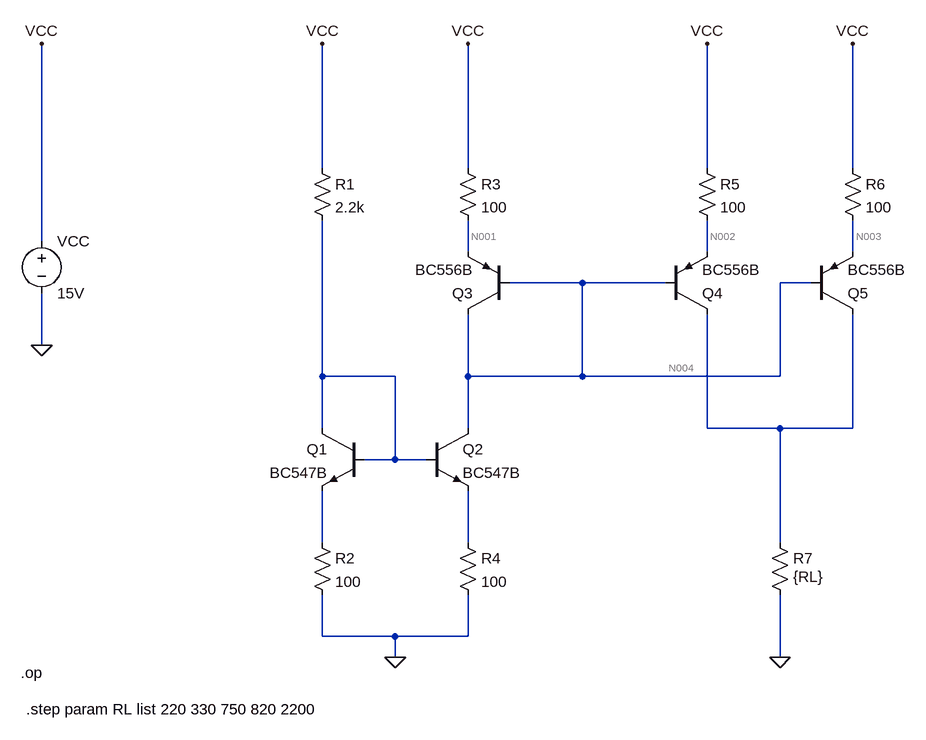
[diagram p0: schematic Draft1.asc]
Draft1.asc, the LTspice schematic file:
Version 4
SHEET 1 1180 896
WIRE -64 48 -64 -144
WIRE 160 48 160 -144
WIRE 528 48 528 -144
WIRE 752 48 752 -144
WIRE -496 160 -496 -144
WIRE 160 176 160 128
WIRE 528 176 528 128
WIRE 752 176 752 128
WIRE 336 224 224 224
WIRE 464 224 336 224
WIRE 688 224 640 224
WIRE -496 320 -496 240
WIRE -64 368 -64 128
WIRE 48 368 -64 368
WIRE 160 368 160 272
WIRE 336 368 336 224
WIRE 336 368 160 368
WIRE 640 368 640 224
WIRE 640 368 336 368
WIRE -64 448 -64 368
WIRE 160 448 160 368
WIRE 528 448 528 272
WIRE 640 448 528 448
WIRE 752 448 752 272
WIRE 752 448 640 448
WIRE 48 496 48 368
WIRE 48 496 0 496
WIRE 96 496 48 496
WIRE -64 624 -64 544
WIRE 160 624 160 544
WIRE 640 624 640 448
WIRE -64 768 -64 704
WIRE 48 768 -64 768
WIRE 160 768 160 704
WIRE 160 768 48 768
WIRE 48 800 48 768
WIRE 640 800 640 704
FLAG 640 800 0
FLAG 48 800 0
FLAG -496 320 0
FLAG -496 -144 VCC
FLAG -64 -144 VCC
FLAG 160 -144 VCC
FLAG 528 -144 VCC
FLAG 752 -144 VCC
SYMBOL res -80 32 R0
SYMATTR InstName R1
SYMATTR Value 2.2k
SYMBOL res -80 608 R0
SYMATTR InstName R2
SYMATTR Value 100
SYMBOL res 144 32 R0
SYMATTR InstName R3
SYMATTR Value 100
SYMBOL res 144 608 R0
SYMATTR InstName R4
SYMATTR Value 100
SYMBOL res 512 32 R0
SYMATTR InstName R5
SYMATTR Value 100
SYMBOL res 736 32 R0
SYMATTR InstName R6
SYMATTR Value 100
SYMBOL res 624 608 R0
WINDOW 3 36 68 Left 2
SYMATTR Value {RL}
SYMATTR InstName R7
SYMBOL npn 0 448 M0
SYMATTR InstName Q1
SYMATTR Value BC547B
SYMBOL npn 96 448 R0
SYMATTR InstName Q2
SYMATTR Value BC547B
SYMBOL pnp 224 272 R180
SYMATTR InstName Q3
SYMATTR Value BC556B
SYMBOL pnp 464 272 M180
SYMATTR InstName Q4
SYMATTR Value BC556B
SYMBOL pnp 688 272 M180
SYMATTR InstName Q5
SYMATTR Value BC556B
SYMBOL voltage -496 144 R0
WINDOW 123 0 0 Left 0
WINDOW 39 0 0 Left 0
SYMATTR InstName VCC
SYMATTR Value 15V
TEXT -528 824 Left 2 !.op
TEXT -520 880 Left 2 !.step param RL list 220 330 750 820 2200

The netlist it stands for:
* Draft1.asc
R1 VCC N005 2.2k
R2 N007 0 100
R3 VCC N001 100
R4 N008 0 100
R5 VCC N002 100
R6 VCC N003 100
R7 N006 0 {RL}
Q1 N005 N005 N007 0 BC547B
Q2 N004 N005 N008 0 BC547B
Q3 N004 N004 N001 0 BC556B
Q4 N006 N004 N002 0 BC556B
Q5 N006 N004 N003 0 BC556B
VCC VCC 0 15V
.model NPN NPN
.model PNP PNP
.lib standard.bjt
.op
.step param RL list 220 330 750 820 2200
.backanno
.end

* Results of the author's LTspice run, read from the files saved beside the schematic
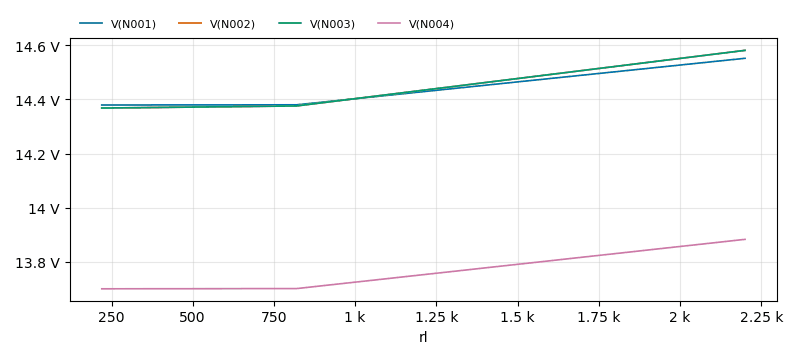
[diagram p1: Operating Point of Draft1.asc, plotted from the saved traces]
* Operating Point, 1 run:
*   V(N001): 14.38 V at rl=220 , 14.55 V at rl=2.2 k, min 14.38 V, max 14.55 V
*   V(N002): 14.37 V at rl=220 , 14.58 V at rl=2.2 k, min 14.37 V, max 14.58 V
*   V(N003): 14.37 V at rl=220 , 14.58 V at rl=2.2 k, min 14.37 V, max 14.58 V
*   V(N004): 13.7 V at rl=220 , 13.88 V at rl=2.2 k, min 13.7 V, max 13.88 V
* From the log:
*   Semiconductor Device Operating Points:
*                           --- Bipolar Transistors ---
*   Name:       q5          q4          q3          q2          q1
*   Model:    bc556b      bc556b      bc556b      bc547b      bc547b
*   Ib:      -1.31e-05   -1.31e-05   -2.01e-05    1.89e-05    2.27e-05
*   Ic:      -6.30e-03   -6.30e-03   -6.19e-03    6.23e-03    6.18e-03
*   Vbe:     -6.68e-01   -6.68e-01   -6.79e-01    6.85e-01    6.90e-01
*   Vbc:      1.09e+01    1.09e+01    0.00e+00   -1.24e+01    0.00e+00
*   Vce:     -1.16e+01   -1.16e+01   -6.79e-01    1.31e+01    6.90e-01
*   BetaDC:   4.81e+02    4.81e+02    3.08e+02    3.30e+02    2.72e+02
*   Gm:       2.30e-01    2.30e-01    2.21e-01    2.30e-01    2.27e-01
*   Rpi:      2.00e+03    2.00e+03    1.30e+03    1.38e+03    1.15e+03
*   Rx:       1.00e+00    1.00e+00    1.00e+00    1.00e+00    1.00e+00
*   Ro:       5.01e+03    5.01e+03    3.34e+03    1.19e+04    9.95e+03
*   Cbe:      1.64e-10    1.64e-10    1.62e-10    1.67e-10    1.70e-10
*   Cbc:      1.28e-12    1.28e-12    6.88e-12    8.29e-13    2.32e-12
*   Cjs:      0.00e+00    0.00e+00    0.00e+00    0.00e+00    0.00e+00
*   BetaAC:   4.60e+02    4.60e+02    2.88e+02    3.18e+02    2.61e+02
*   Cbx:      7.56e-13    7.56e-13    4.06e-12    5.10e-13    1.42e-12
*   Ft:       2.20e+08    2.20e+08    2.03e+08    2.18e+08    2.07e+08